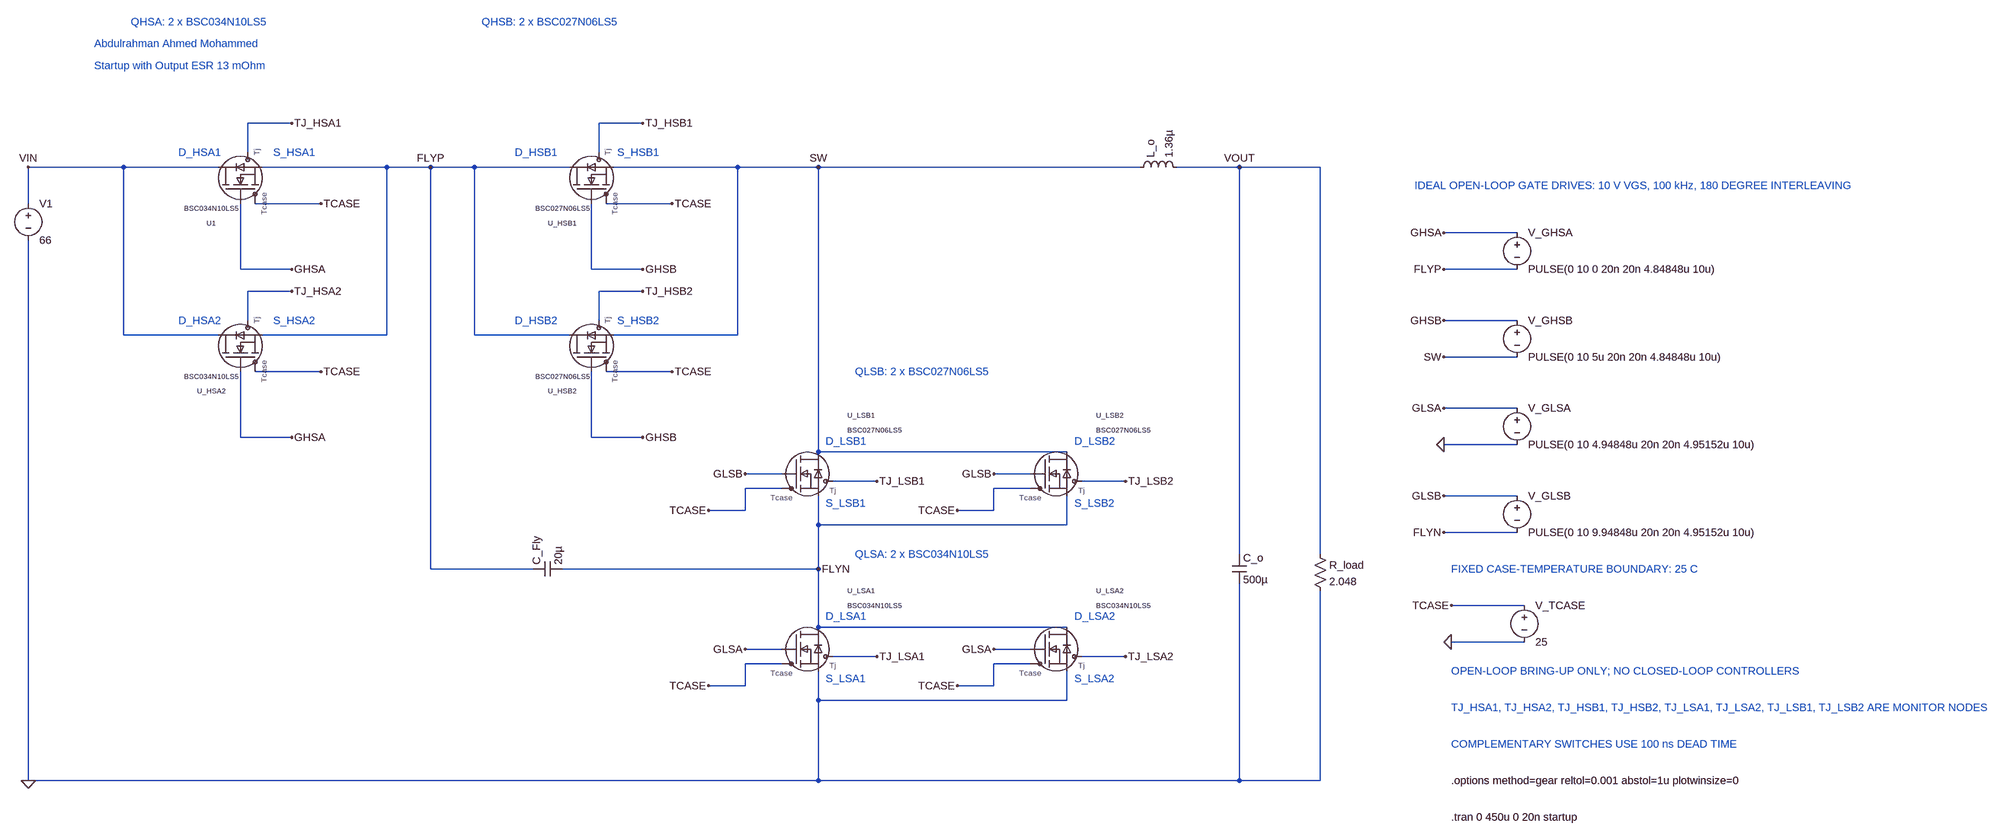
[diagram p0: schematic Startup_with_Output_ESR_13_mOhm.asc]
Startup_with_Output_ESR_13_mOhm.asc, the LTspice schematic file:
Version 4.1
SHEET 1 4532 1696
WIRE 592 -16 496 -16
WIRE 1360 -16 1264 -16
WIRE 496 48 496 -16
WIRE 1264 48 1264 -16
WIRE 224 80 16 80
WIRE 432 80 224 80
WIRE 800 80 528 80
WIRE 896 80 800 80
WIRE 992 80 896 80
WIRE 1200 80 992 80
WIRE 1568 80 1296 80
WIRE 1744 80 1568 80
WIRE 2448 80 1744 80
WIRE 2672 80 2528 80
WIRE 2992 80 2672 80
WIRE 16 160 16 80
WIRE 656 160 512 160
WIRE 1424 160 1280 160
WIRE 3456 224 3296 224
WIRE 480 304 480 160
WIRE 592 304 480 304
WIRE 1248 304 1248 160
WIRE 1360 304 1248 304
WIRE 3456 304 3296 304
WIRE 592 352 496 352
WIRE 1360 352 1264 352
WIRE 496 416 496 352
WIRE 1264 416 1264 352
WIRE 3456 416 3296 416
WIRE 224 448 224 80
WIRE 432 448 224 448
WIRE 800 448 800 80
WIRE 800 448 528 448
WIRE 992 448 992 80
WIRE 1200 448 992 448
WIRE 1568 448 1568 80
WIRE 1568 448 1296 448
WIRE 3456 496 3296 496
WIRE 656 528 512 528
WIRE 1424 528 1280 528
WIRE 3456 608 3296 608
WIRE 480 672 480 528
WIRE 592 672 480 672
WIRE 1248 672 1248 528
WIRE 1360 672 1248 672
WIRE 3456 688 3296 688
WIRE 1744 704 1744 80
WIRE 2288 704 1744 704
WIRE 1664 752 1584 752
WIRE 2208 752 2128 752
WIRE 1872 768 1776 768
WIRE 2416 768 2320 768
WIRE 1664 784 1584 784
WIRE 2208 784 2128 784
WIRE 3456 800 3296 800
WIRE 1584 832 1584 784
WIRE 1584 832 1504 832
WIRE 2128 832 2128 784
WIRE 2128 832 2048 832
WIRE 1744 864 1744 800
WIRE 2288 864 2288 800
WIRE 2288 864 1744 864
WIRE 3456 880 3296 880
WIRE 2672 928 2672 80
WIRE 2992 928 2992 80
WIRE 896 960 896 80
WIRE 1120 960 896 960
WIRE 1744 960 1744 864
WIRE 1744 960 1184 960
WIRE 3472 1040 3312 1040
WIRE 1744 1088 1744 960
WIRE 2288 1088 1744 1088
WIRE 3472 1120 3312 1120
WIRE 1664 1136 1584 1136
WIRE 2208 1136 2128 1136
WIRE 1872 1152 1776 1152
WIRE 2416 1152 2320 1152
WIRE 1664 1168 1584 1168
WIRE 2208 1168 2128 1168
WIRE 1584 1216 1584 1168
WIRE 1584 1216 1504 1216
WIRE 2128 1216 2128 1168
WIRE 2128 1216 2048 1216
WIRE 1744 1248 1744 1184
WIRE 2288 1248 2288 1184
WIRE 2288 1248 1744 1248
WIRE 16 1424 16 240
WIRE 1744 1424 1744 1248
WIRE 1744 1424 16 1424
WIRE 2672 1424 2672 992
WIRE 2672 1424 1744 1424
WIRE 2992 1424 2992 1008
WIRE 2992 1424 2672 1424
FLAG 16 1424 0
FLAG 16 80 VIN
FLAG 592 304 GHSA
FLAG 656 160 TCASE
FLAG 592 -16 TJ_HSA1
FLAG 592 672 GHSA
FLAG 656 528 TCASE
FLAG 592 352 TJ_HSA2
FLAG 1360 304 GHSB
FLAG 1424 160 TCASE
FLAG 1360 -16 TJ_HSB1
FLAG 1360 672 GHSB
FLAG 1424 528 TCASE
FLAG 1360 352 TJ_HSB2
FLAG 896 80 FLYP
FLAG 1744 80 SW
FLAG 1584 752 GLSB
FLAG 1504 832 TCASE
FLAG 1872 768 TJ_LSB1
FLAG 2128 752 GLSB
FLAG 2048 832 TCASE
FLAG 2416 768 TJ_LSB2
FLAG 1584 1136 GLSA
FLAG 1504 1216 TCASE
FLAG 1872 1152 TJ_LSA1
FLAG 2128 1136 GLSA
FLAG 2048 1216 TCASE
FLAG 2416 1152 TJ_LSA2
FLAG 1744 960 FLYN
FLAG 2672 80 VOUT
FLAG 3296 224 GHSA
FLAG 3296 304 FLYP
FLAG 3296 416 GHSB
FLAG 3296 496 SW
FLAG 3296 608 GLSA
FLAG 3296 688 0
FLAG 3296 800 GLSB
FLAG 3296 880 FLYN
FLAG 3312 1040 TCASE
FLAG 3312 1120 0
SYMBOL voltage 16 144 R0
SYMATTR InstName V1
SYMATTR Value 66
SYMBOL BSC034N10LS5 480 112 R270
WINDOW 0 -80 -64 VBottom 1
WINDOW 38 -48 -64 VBottom 1
SYMATTR InstName U1
SYMBOL BSC034N10LS5 480 480 R270
WINDOW 0 -80 -64 VBottom 1
WINDOW 38 -48 -64 VBottom 1
SYMATTR InstName U_HSA2
SYMBOL BSC027N06LS5 1248 112 R270
WINDOW 0 -80 -64 VBottom 1
WINDOW 38 -48 -64 VBottom 1
SYMATTR InstName U_HSB1
SYMBOL BSC027N06LS5 1248 480 R270
WINDOW 0 -80 -64 VBottom 1
WINDOW 38 -48 -64 VBottom 1
SYMATTR InstName U_HSB2
SYMBOL BSC027N06LS5 1712 752 R0
WINDOW 0 96 -128 Left 1
WINDOW 38 96 -96 Left 1
SYMATTR InstName U_LSB1
SYMBOL BSC027N06LS5 2256 752 R0
WINDOW 0 96 -128 Left 1
WINDOW 38 96 -96 Left 1
SYMATTR InstName U_LSB2
SYMBOL BSC034N10LS5 1712 1136 R0
WINDOW 0 96 -128 Left 1
WINDOW 38 96 -96 Left 1
SYMATTR InstName U_LSA1
SYMBOL BSC034N10LS5 2256 1136 R0
WINDOW 0 96 -128 Left 1
WINDOW 38 96 -96 Left 1
SYMATTR InstName U_LSA2
SYMBOL cap 1120 976 R270
SYMATTR SpiceLine Rser=3m
SYMATTR InstName C_Fly
SYMATTR Value 20µ
SYMBOL ind 2432 96 R270
SYMATTR InstName L_o
SYMATTR Value 1.36µ
SYMBOL cap 2656 928 R0
SYMATTR SpiceLine Rser=0.013
SYMATTR InstName C_o
SYMATTR Value 500µ
SYMBOL res 2976 912 R0
SYMATTR InstName R_load
SYMATTR Value 2.048
SYMBOL voltage 3456 208 R0
SYMATTR InstName V_GHSA
SYMATTR Value PULSE(0 10 0 20n 20n 4.84848u 10u)
SYMBOL voltage 3456 400 R0
SYMATTR InstName V_GHSB
SYMATTR Value PULSE(0 10 5u 20n 20n 4.84848u 10u)
SYMBOL voltage 3456 592 R0
SYMATTR InstName V_GLSA
SYMATTR Value PULSE(0 10 4.94848u 20n 20n 4.95152u 10u)
SYMBOL voltage 3456 784 R0
SYMATTR InstName V_GLSB
SYMATTR Value PULSE(0 10 9.94848u 20n 20n 4.95152u 10u)
SYMBOL voltage 3472 1024 R0
SYMATTR InstName V_TCASE
SYMATTR Value 25
TEXT 240 -240 Left 2 ;QHSA: 2 x BSC034N10LS5
TEXT 1008 -240 Left 2 ;QHSB: 2 x BSC027N06LS5
TEXT 1824 528 Left 2 ;QLSB: 2 x BSC027N06LS5
TEXT 1824 928 Left 2 ;QLSA: 2 x BSC034N10LS5
TEXT 344 48 Left 2 ;D_HSA1
TEXT 552 48 Left 2 ;S_HSA1
TEXT 344 416 Left 2 ;D_HSA2
TEXT 552 416 Left 2 ;S_HSA2
TEXT 1080 48 Left 2 ;D_HSB1
TEXT 1304 48 Left 2 ;S_HSB1
TEXT 1080 416 Left 2 ;D_HSB2
TEXT 1304 416 Left 2 ;S_HSB2
TEXT 1760 680 Left 2 ;D_LSB1
TEXT 1760 816 Left 2 ;S_LSB1
TEXT 2304 680 Left 2 ;D_LSB2
TEXT 2304 816 Left 2 ;S_LSB2
TEXT 1760 1064 Left 2 ;D_LSA1
TEXT 1760 1200 Left 2 ;S_LSA1
TEXT 2304 1064 Left 2 ;D_LSA2
TEXT 2304 1200 Left 2 ;S_LSA2
TEXT 3232 120 Left 2 ;IDEAL OPEN-LOOP GATE DRIVES: 10 V VGS, 100 kHz, 180 DEGREE INTERLEAVING
TEXT 3312 960 Left 2 ;FIXED CASE-TEMPERATURE BOUNDARY: 25 C
TEXT 3312 1184 Left 2 ;OPEN-LOOP BRING-UP ONLY; NO CLOSED-LOOP CONTROLLERS
TEXT 3312 1264 Left 2 ;TJ_HSA1, TJ_HSA2, TJ_HSB1, TJ_HSB2, TJ_LSA1, TJ_LSA2, TJ_LSB1, TJ_LSB2 ARE MONITOR NODES
TEXT 3312 1344 Left 2 ;COMPLEMENTARY SWITCHES USE 100 ns DEAD TIME
TEXT 3312 1424 Left 2 !.options method=gear reltol=0.001 abstol=1u plotwinsize=0
TEXT 3312 1504 Left 2 !.tran 0 450u 0 20n startup

TEXT 160 -192 Left 2 ;Abdulrahman Ahmed Mohammed
TEXT 160 -144 Left 2 ;Startup with Output ESR 13 mOhm

The netlist it stands for:
* Startup_with_Output_ESR_13_mOhm.asc
V1 VIN 0 66
X§U1 VIN GHSA FLYP TJ_HSA1 TCASE BSC034N10LS5  ; pins drain gate source Tj Tcase
X§U_HSA2 VIN GHSA FLYP TJ_HSA2 TCASE BSC034N10LS5  ; pins drain gate source Tj Tcase
X§U_HSB1 FLYP GHSB SW TJ_HSB1 TCASE BSC027N06LS5  ; pins drain gate source Tj Tcase
X§U_HSB2 FLYP GHSB SW TJ_HSB2 TCASE BSC027N06LS5  ; pins drain gate source Tj Tcase
X§U_LSB1 SW GLSB FLYN TJ_LSB1 TCASE BSC027N06LS5  ; pins drain gate source Tj Tcase
X§U_LSB2 SW GLSB FLYN TJ_LSB2 TCASE BSC027N06LS5  ; pins drain gate source Tj Tcase
X§U_LSA1 FLYN GLSA 0 TJ_LSA1 TCASE BSC034N10LS5  ; pins drain gate source Tj Tcase
X§U_LSA2 FLYN GLSA 0 TJ_LSA2 TCASE BSC034N10LS5  ; pins drain gate source Tj Tcase
C_Fly FLYP FLYN 20µ Rser=3m
L_o SW VOUT 1.36µ
C_o VOUT 0 500µ Rser=0.013
R_load VOUT 0 2.048
V_GHSA GHSA FLYP PULSE(0 10 0 20n 20n 4.84848u 10u)
V_GHSB GHSB SW PULSE(0 10 5u 20n 20n 4.84848u 10u)
V_GLSA GLSA 0 PULSE(0 10 4.94848u 20n 20n 4.95152u 10u)
V_GLSB GLSB FLYN PULSE(0 10 9.94848u 20n 20n 4.95152u 10u)
V_TCASE TCASE 0 25
* QHSA: 2 x BSC034N10LS5
* QHSB: 2 x BSC027N06LS5
* QLSB: 2 x BSC027N06LS5
* QLSA: 2 x BSC034N10LS5
* D_HSA1
* S_HSA1
* D_HSA2
* S_HSA2
* D_HSB1
* S_HSB1
* D_HSB2
* S_HSB2
* D_LSB1
* S_LSB1
* D_LSB2
* S_LSB2
* D_LSA1
* S_LSA1
* D_LSA2
* S_LSA2
* IDEAL OPEN-LOOP GATE DRIVES: 10 V VGS, 100 kHz, 180 DEGREE INTERLEAVING
* FIXED CASE-TEMPERATURE BOUNDARY: 25 C
* OPEN-LOOP BRING-UP ONLY; NO CLOSED-LOOP CONTROLLERS
* TJ_HSA1, TJ_HSA2, TJ_HSB1, TJ_HSB2, TJ_LSA1, TJ_LSA2, TJ_LSB1, TJ_LSB2 ARE MONITOR NODES
* COMPLEMENTARY SWITCHES USE 100 ns DEAD TIME
.options method=gear reltol=0.001 abstol=1u plotwinsize=0
.tran 0 450u 0 20n startup
* Abdulrahman Ahmed Mohammed
* Startup with Output ESR 13 mOhm
.lib OptiMOS5_100V_LTSpice.lib
.lib OptiMOS_OptiMOS5_60V_LTSpice.lib
.backanno
.end